# Altium project PCB_MCTA_INT.PrjPcb
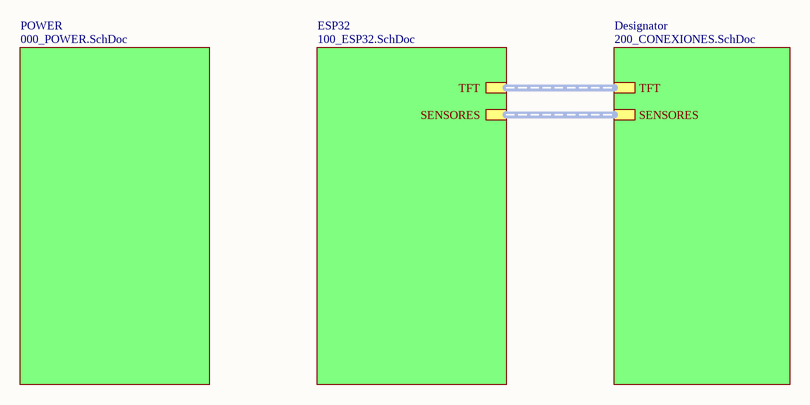
[diagram p0: Main.SchDoc]
4 sheets, 33 parts. Net scope: hierarchical (ports join the sheet entries above them; power ports are global).
Board file: PCB_MACETA.PcbDoc
Sheets:
  Main.SchDoc
    POWER = 000_POWER.SchDoc
    ESP32 = 100_ESP32.SchDoc
    Designator = 200_CONEXIONES.SchDoc

## Sheet Main.SchDoc: Maceta_Inteligente
size A4; DrawnBy: Alexis Andres Valencia; Revision: V1R1; SheetNumber: 1; SheetTotal: 4

### Sub-sheets
Designator = 200_CONEXIONES.SchDoc: TFT (harness TFT_HARNESS), SENSORES (harness SESORES_HARNESS)
ESP32 = 100_ESP32.SchDoc: TFT (harness TFT_HARNESS), SENSORES (harness SESORES_HARNESS)
POWER = 000_POWER.SchDoc: no entries

### Buses and harness runs
harness sheet Designator/SENSORES = sheet ESP32/SENSORES
harness sheet Designator/TFT = sheet ESP32/TFT

## Sheet 000_POWER.SchDoc: MACETA INTELIGENTE
size A4; DrawnBy: ALEXIS VALENCIA; SheetNumber: 2; SheetTotal: 4
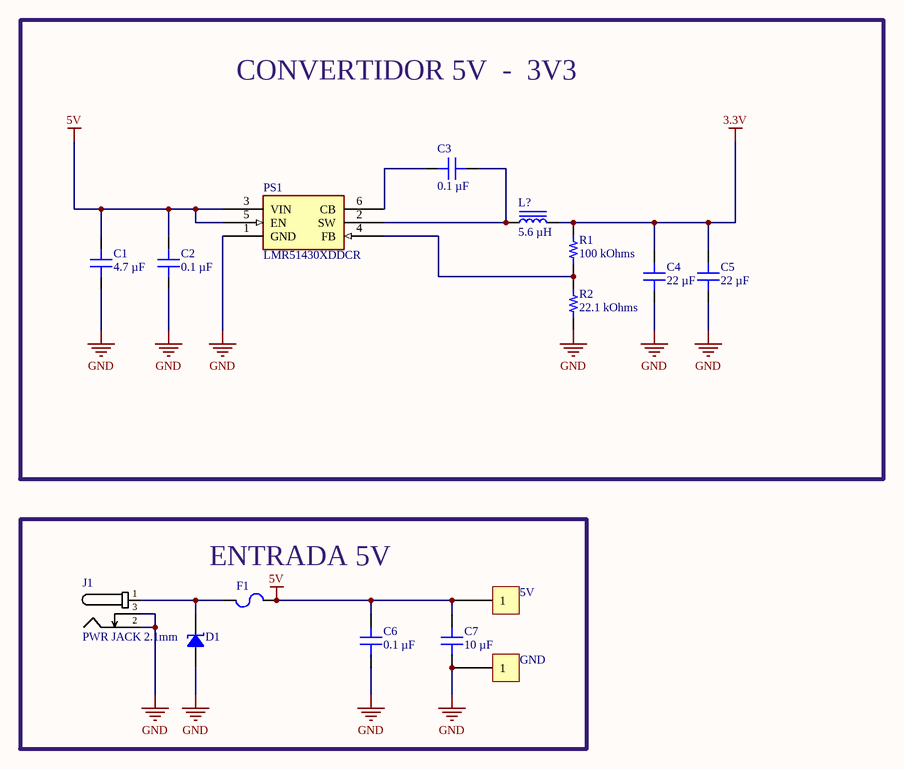
[diagram p1: 000_POWER.SchDoc]

### Parts
C1  4.7 µF  [CAP 0603_1608]
C2  0.1 µF  [CAP 0603_1608]
C3  0.1 µF  [CAP 0603_1608]
C4  22 µF  [CAP 0603_1608]
C5  22 µF  [CAP 0603_1608]
C6  0.1 µF  [CAP 0603_1608]
C7  10 µF  [CAP 0603_1608]
D1  SMAJ5.0A  [DO214AC SMA]  (value not drawn)
F1  MFU1206FF05000P100  [FUSE 1206_3216 0.6MM]  (value not drawn)
J1  PWR JACK 2.1mm  [CON_POWER_BARREL_2.1MM_3CONN]
L1  5.6 µH  [WURTH WE-PD 1280]
PS1  LMR51430XDDCR  [SOT95P280X110-6N]
R1  100 kOhms  [RES 0603_1608]
R2  22.1 kOhms  [RES 0603_1608]
TP1  5V  [Pad_SMD]
TP2  GND  [Pad_SMD]

### Blocks framed on the sheet
CONVERTIDOR 5V  -  3V3: C1-C5 L1 PS1 R1 R2
ENTRADA 5V: C6 C7 D1 F1 J1 TP1 TP2

### Nets
3.3V: C4.2 C5.2 L1.2 R1.2
5V: C1.2 C2.2 C6.2 C7.2 F1.2 PS1.3(VIN) PS1.5(EN) TP1.TP?(1)
GND: C1.1 C2.1 C4.1 C5.1 C6.1 C7.1 D1.1 J1.2 J1.3 PS1.1(GND) R2.1 TP2.TP?(1)
NetC3_1: C3.1 L1.1 PS1.2(SW)
NetC3_2: C3.2 PS1.6(CB)
NetD1_2: D1.2 F1.1 J1.1
NetPS1_4: PS1.4(FB) R1.1 R2.2

### Library data of the parts
C1 = 06033D475KAT2A: CAP CER 4.7UF 25V X5R 0603; manufacturer: KYOCERA AVX; Tolerance: ±10%; Part Number: 06033D475KAT2A; Capacitance: 4.7 µF; Applications: General Purpose; componentlink1description: Datasheet; componentlink1url: https://datasheets.kyocera-avx.com/cx5r.pdf; componentlink2description: DigiKey Link; componentlink2url: https://www.digikey.com/en/products/detail/kyocera-avx/06033D475KAT2A/10815061; Device Package: 0603 (1608 Metric); lastupdated: 6/04/2026 7:22:31 p. m.; Lifecycle Status: Active; Minimum Order: 1; Mounting Type: Surface Mount, MLCC; Operating Temperature: -55°C ~ 85°C; Package / Case: 0603 (1608 Metric); packaging: TapeAndReel; partid: 35784; Part Status: Active; price: 0.09; series: KGM - X5R; Size / Dimension: 0.063" L x 0.031" W (1.60mm x 0.80mm); Supplier 1: DigiKey; Supplier Part Number 1: 478-KGM15CR51E475KTCT-ND; Temperature Coefficient: X5R; Thickness (Max): 0.039" (1.00mm); value: 4.7 µF; Voltage - Rated: 25V
C2 C3 C6 = CL10E104KC8VPNC: CAP CER 100NF 100V X8L 0603; manufacturer: Samsung Electro-Mechanics; Tolerance: ±10%; Part Number: CL10E104KC8VPNC; Capacitance: 0.1 µF; Applications: Automotive; componentlink1description: Datasheet; componentlink1url: https://mm.digikey.com/Volume0/opasdata/d220001/medias/docus/5458/CL10E104KC8VPNC_Spec.pdf; componentlink2description: DigiKey Link; componentlink2url: https://www.digikey.com/en/products/detail/samsung-electro-mechanics/CL10E104KC8VPNC/20498486; Device Package: 0603 (1608 Metric); Features: General Purpose; lastupdated: 6/04/2026 7:18:46 p. m.; Lifecycle Status: Active; Minimum Order: 1; Mounting Type: Surface Mount, MLCC, Epoxy; Operating Temperature: -55°C ~ 150°C; Package / Case: 0603 (1608 Metric); packaging: TapeAndReel; partid: 68845; price: 0.04; Ratings: AEC-Q200; series: CL; Size / Dimension: 0.063" L x 0.031" W (1.60mm x 0.80mm); Supplier 1: DigiKey; Supplier Part Number 1: 1276-CL10E104KC8VPNCCT-ND; Temperature Coefficient: X8L; Thickness (Max): 0.035" (0.88mm); value: 0.1 µF; Voltage - Rated: 100V
C4 C5 = 0603YD226MAT2A: CAP CER 22UF 16V X5R 0603; manufacturer: KYOCERA AVX; Tolerance: ±20%; Part Number: 0603YD226MAT2A; Capacitance: 22 µF; Applications: General Purpose; componentlink1description: Datasheet; componentlink1url: https://datasheets.kyocera-avx.com/cx5r-KGM.pdf; componentlink2description: DigiKey Link; componentlink2url: https://www.digikey.com/en/products/detail/kyocera-avx/0603YD226MAT2A/17866383; Device Package: 0603 (1608 Metric); lastupdated: 6/04/2026 7:18:42 p. m.; Lifecycle Status: Active; Minimum Order: 1; Mounting Type: Surface Mount, MLCC; Operating Temperature: -55°C ~ 85°C; Package / Case: 0603 (1608 Metric); packaging: TapeAndReel; partid: 68615; price: 0.11; series: KGM - X5R; Size / Dimension: 0.063" L x 0.031" W (1.60mm x 0.80mm); Supplier 1: DigiKey; Supplier Part Number 1: 478-KGM15CR51C226MTCT-ND; Temperature Coefficient: X5R; Thickness (Max): 0.039" (1.00mm); value: 22 µF; Voltage - Rated: 16V
C7 = 0603X106M100CT: CAP CER 10UF 10V X5R 0603; manufacturer: Walsin Technology Corporation; Tolerance: ±20%; Part Number: 0603X106M100CT; Capacitance: 10 µF; Applications: General Purpose; componentlink1description: Datasheet; componentlink1url: https://www.passivecomponent.com/wp-content/uploads/datasheet/WTC_MLCC_General_Purpose.pdf; componentlink2description: DigiKey Link; componentlink2url: https://www.digikey.com/en/products/detail/walsin-technology-corporation/0603X106M100CT/15983159; Device Package: 0603 (1608 Metric); lastupdated: 6/04/2026 7:17:37 p. m.; Lifecycle Status: Active; Minimum Order: 1; Mounting Type: Surface Mount, MLCC; Operating Temperature: -55°C ~ 85°C; Package / Case: 0603 (1608 Metric); packaging: TapeAndReel; partid: 64846; price: 0.01; series: -; Size / Dimension: 0.063" L x 0.031" W (1.60mm x 0.80mm); Supplier 1: DigiKey; Supplier Part Number 1: 1292-0603X106M100CT-ND; Temperature Coefficient: X5R; Thickness (Max): 0.037" (0.95mm); value: 10 µF; Voltage - Rated: 10V
D1 = SMAJ5.0A: TVS DIODE 5VWM 9.2VC DO214AC; Manufacturer: Littelfuse Inc.; Current - Peak Pulse (10/1000µs): 43.5A; Power Line Protection: No; Power - Peak Pulse: 400W; Type: Zener; Unidirectional Channels: 1; Voltage - Breakdown (Min): 6.4V; Voltage - Clamping (Max) @ Ipp: 9.2V; Voltage - Reverse Standoff (Typ): 5V; Part Number: SMAJ5.0A; Applications: General Purpose; ComponentLink1Description: Datasheet; ComponentLink1URL: https://www.littelfuse.com/~/media/electronics/datasheets/tvs_diodes/littelfuse_tvs_diode_smaj_datasheet.pdf.pdf; ComponentLink2Description: DigiKey Link; ComponentLink2URL: https://www.digikey.com/en/products/detail/littelfuse-inc/SMAJ5-0A/762250; LastUpdated: 5/04/2026 8:34:16 p. m.; Lifecycle Status: Active; Minimum Order: 1; Mounting Type: Surface Mount; Operating Temperature: -65°C ~ 150°C (TJ); Package / Case: DO-214AC, SMA; Packaging: TapeAndReel; PartId: 5719; Part Status: Active; Price: 0.06; Series: SMAJ; Supplier 1: DigiKey; Supplier Part Number 1: SMAJ5.0ALFCT-ND; Supplier Device Package: DO-214AC (SMA)
F1 = MFU1206FF05000P100: FUSE BOARD MOUNT 5A 63VDC 1206; Manufacturer: Vishay Beyschlag; Approval Agency: UL; Breaking Capacity @ Rated Voltage: 50A; Fuse Type: Board Mount (Cartridge Style Excluded); Melting I²t: 0.2275; Response Time: Fast Blow; Voltage Rating - DC: 63V; Part Number: MFU1206FF05000P100; Approvals: UL; ComponentLink1Description: Datasheet; ComponentLink1URL: http://www.vishay.com/docs/28747/mfuserie.pdf; ComponentLink2Description: DigiKey Link; ComponentLink2URL: http://digikey.com/product-detail/en/vishay-beyschlag/MFU1206FF05000P100/MFU12065.00CT-ND/1206572; Current Rating (Amps): 5A; Device Package: 1206 (3216 Metric); LastUpdated: 2/09/2020 1:30:46 a. m.; Lifecycle Status: Active; Minimum Order: 1; Mounting Type: Surface Mount; Operating Temperature: -55°C ~ 125°C; Package / Case: 1206 (3216 Metric); Packaging: TapeAndReel; Part Status: Active; Price: 0.30; Series: MFU; Size / Dimension: 0.126" L x 0.063" W x 0.022" H (3.20mm x 1.60mm x 0.55mm); Supplier 1: DigiKey; Supplier Part Number 1: MFU12065.00CT-ND
J1 = Con_Power_Jack_2.1mm_3pins: CONN PWR JACK 2X5.5MM SOLDER; Manufacturer: HCTL; Manufacturer Part Number: HC-DC-005-2.0T; Supplier 1: LCSC; Supplier Part Number 1: C3010533; ComponentLink1Description: LCSC; ComponentLink1URL: https://www.lcsc.com/product-detail/AC-DC-Power-Connectors_HCTL-HC-DC-005-2-0T_C3010533.html
L1 = 74477005: FIXED IND 5.6UH 8A 17 MOHM SMD; Manufacturer: Würth Elektronik; Current - Saturation: 8.2A; DC Resistance (DCR): 17mOhm Max; Frequency - Self Resonant: 24MHz; Inductance Frequency - Test: 1 kHz; Material - Core: Ferrite; Shielding: Shielded; Tolerance: -20%, +40%; Type: Drum Core, Wirewound; Part Number: 74477005; ComponentLink2Description: DigiKey Link; ComponentLink2URL: https://www.digikey.com/en/products/detail/würth-elektronik/74477005/9859283; Current Rating (Amps): 8 A; Device Package: Nonstandard; Height - Seated (Max): 0.315" (8.00mm); Inductance: 5.6 µH; LastUpdated: 5/04/2026 9:05:06 p. m.; Lifecycle Status: Active; Minimum Order: 1; Mounting Type: Surface Mount; Operating Temperature: -40°C ~ 125°C; Package / Case: Nonstandard; Packaging: TapeAndReel; PartId: 5767; Part Status: Active; Price: 1.20; Ratings: AEC-Q200; Series: WE-PD; Size / Dimension: 0.472" L x 0.472" W (12.00mm x 12.00mm); Supplier 1: DigiKey; Supplier Part Number 1: 732-13489-1-ND; Value: 5.6 µH
PS1 = LMR51430XDDCR: Power Supply; Manufacturer_Name: Texas Instruments; Datasheet Link: https://www.ti.com/lit/ds/symlink/lmr51430.pdf?HQS=dis-mous-null-mousermode-dsf-pf-null-wwe&ts=1665567212982&ref_url=https%253A%252F%252Fwww.mouser.co.uk%252F; Height: 1.1mm; Manufacturer_Part_Number: LMR51430XDDCR; Mouser Part Number: 595-LMR51430XDDCR; Mouser Price/Stock: https://www.mouser.co.uk/ProductDetail/Texas-Instruments/LMR51430XDDCR?qs=vvQtp7zwQdP8miJIr5Aupg%3D%3D; Arrow Part Number: LMR51430XDDCR; Arrow Price/Stock: https://www.arrow.com/en/products/lmr51430xddcr/texas-instruments.html?utm_currency=USD&region=asia
R1 = AA0603FR-07100KL: RES SMD 100K OHM 1% 1/10W 0603; Manufacturer: Yageo; Power (Watts): 0.1W, 1/10W; Temperature Coefficient: ±150ppm/°C; Part Number: AA0603FR-07100KL; Value: 100 kOhms; ComponentLink1Description: Datasheet; ComponentLink1URL: https://www.yageo.com/upload/media/product/productsearch/datasheet/rchip/PYu-AA_51_RoHS_L_3.pdf; ComponentLink2Description: DigiKey Link; ComponentLink2URL: https://www.digikey.com/en/products/detail/yageo/AA0603FR-07100KL/5888687; Composition: Thick Film; Device Package: 0603 (1608 Metric); Features: Anti-Sulfur, Automotive AEC-Q200, Moisture Resistant; Height - Seated (Max): 0.022" (0.55mm); LastUpdated: 6/04/2026 7:43:21 p. m.; Lifecycle Status: Active; Minimum Order: 1; Number of Terminations: 2; Operating Temperature: -55°C ~ 155°C; Package / Case: 0603 (1608 Metric); Packaging: TapeAndReel; PartId: 78895; Price: 0.01; Ratings: AEC-Q200; Resistance: 100 kOhms; Series: AA; Size / Dimension: 0.063" L x 0.031" W (1.60mm x 0.80mm); Supplier 1: DigiKey; Supplier Part Number 1: 13-AA0603FR-07100KLCT-ND; Supplier Device Package: 0603; Tolerance: ±1%
R2 = AC0603FR-0722K1L: RES SMD 22.1K OHM 1% 1/10W 0603; Manufacturer: Yageo; Power (Watts): 0.1W, 1/10W; Temperature Coefficient: ±100ppm/°C; Part Number: AC0603FR-0722K1L; Value: 22.1 kOhms; ComponentLink1Description: Datasheet; ComponentLink1URL: https://www.yageo.com/upload/media/product/productsearch/datasheet/rchip/PYu-AC_51_RoHS_L_7.pdf; ComponentLink2Description: DigiKey Link; ComponentLink2URL: https://www.digikey.com/en/products/detail/yageo/AC0603FR-0722K1L/5895923; Composition: Thick Film; Device Package: 0603 (1608 Metric); Features: Automotive AEC-Q200, Moisture Resistant; Height - Seated (Max): 0.022" (0.55mm); LastUpdated: 6/04/2026 7:43:51 p. m.; Lifecycle Status: Active; Minimum Order: 1; Number of Terminations: 2; Operating Temperature: -55°C ~ 155°C; Package / Case: 0603 (1608 Metric); Packaging: CutTape; PartId: 15830; Part Status: Active; Price: 0.01; Ratings: AEC-Q200; Resistance: 22.1 kOhms; Series: AC; Size / Dimension: 0.063" L x 0.031" W (1.60mm x 0.80mm); Supplier 1: DigiKey; Supplier Part Number 1: YAG5325CT-ND; Supplier Device Package: 0603; Tolerance: ±1%
TP1 TP2 = Test: Test1.5mm

## Sheet 100_ESP32.SchDoc: MACETA INTELIGENTE
size A4; DrawnBy: ALEXIS VALENCIA; SheetNumber: 3; SheetTotal: 4
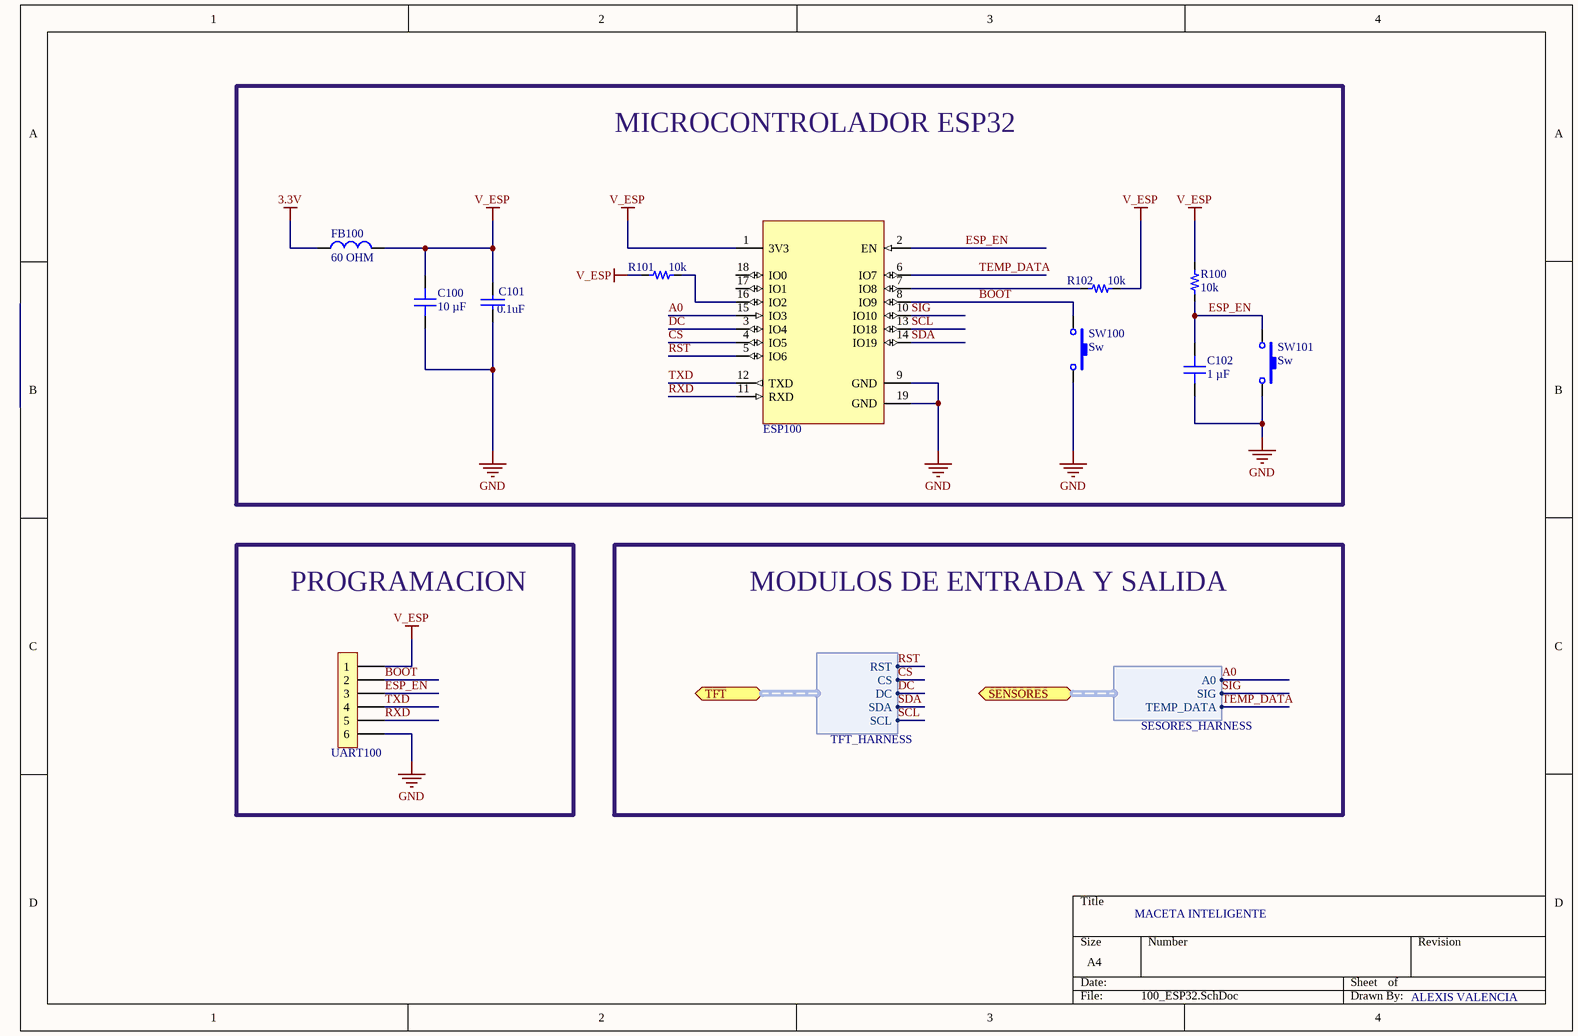
[diagram p2: 100_ESP32.SchDoc]

### Parts
C100  10 µF  [CAP 0603_1608]
C101  value 0.1uF  [0603_cap]  (hidden comment: 0.1uF 50V)
C102  1 µF  [CAP 0603_1608]
ESP100  ESP32-C3-WROOM-02-N4  [ESP32-C3-WROOM-02-N4]  (value not drawn)
FB100  value 60 OHM  [0603_fb]  (hidden comment: 60OHM 2A)
R100  value 10k  [0603_res]  (hidden comment: 10k 1/10W)
R101  value 10k  [0603_res]  (hidden comment: 10k 1/10W)
R102  value 10k  [0603_res]  (hidden comment: 10k 1/10W)
SW100  Sw  [Sw_PUSH_4.5x4.5x5mm]
SW101  Sw  [Sw_PUSH_4.5x4.5x5mm]
UART100  6x1  [H_6x1_TH_100mil]  (value not drawn)  (no BOM)

### Blocks framed on the sheet
MICROCONTROLADOR ESP32: C100-C102 ESP100 FB100 R100-R102 SW100 SW101
PROGRAMACION: UART100

### Ports
SENSORES (bidir, harness SESORES_HARNESS), TFT (bidir, harness TFT_HARNESS)

### Harnesses
TFT_HARNESS: RST, CS, DC, SDA, SCL
SESORES_HARNESS: A0, SIG, TEMP_DATA

### Nets
3.3V: FB100.1
GND: C100.1 C101.2 C102.1 ESP100.9(GND) ESP100.19(GND) SW100.2 SW101.2 UART100.6
V_ESP: C100.2 C101.1 ESP100.1(3V3) FB100.2 R100.2 R101.1 R102.2 UART100.1
A0: ESP100.15(IO3) ; port SENSORES.A0
BOOT: ESP100.8(IO9) SW100.1 UART100.2
CS: ESP100.4(IO5) ; port TFT.CS
DC: ESP100.3(IO4) ; port TFT.DC
ESP_EN: C102.2 ESP100.2(EN) R100.1 SW101.1 UART100.3
RST: ESP100.5(IO6) ; port TFT.RST
RXD: ESP100.11(RXD) UART100.5
SCL: ESP100.13(IO18) ; port TFT.SCL
SDA: ESP100.14(IO19) ; port TFT.SDA
SIG: ESP100.10(IO10) ; port SENSORES.SIG
TEMP_DATA: ESP100.6(IO7) ; port SENSORES.TEMP_DATA
TXD: ESP100.12(TXD) UART100.4
NetESP100_7: ESP100.7(IO8) R102.1
NetESP100_16: ESP100.16(IO2) R101.2

Not connected (* = marked no-connect by the designer): ESP100 17(IO1) 18(IO0)

### Notes on the sheet
- MODULOS DE ENTRADA Y SALIDA

### Library data of the parts
C100 = 06033D106KAT2A: CAP CER 10UF 25V X5R 0603; manufacturer: KYOCERA AVX; Tolerance: ±10%; Part Number: 06033D106KAT2A; Capacitance: 10 µF; Applications: General Purpose; componentlink1description: Datasheet; componentlink1url: https://datasheets.kyocera-avx.com/cx5r-KGM.pdf; componentlink2description: DigiKey Link; componentlink2url: https://www.digikey.com/en/products/detail/kyocera-avx/06033D106KAT2A/17866340; Device Package: 0603 (1608 Metric); lastupdated: 6/04/2026 7:18:42 p. m.; Lifecycle Status: Active; Minimum Order: 1; Mounting Type: Surface Mount, MLCC; Operating Temperature: -55°C ~ 85°C; Package / Case: 0603 (1608 Metric); packaging: TapeAndReel; partid: 68623; price: 0.08; series: KGM - X5R; Size / Dimension: 0.063" L x 0.031" W (1.60mm x 0.80mm); Supplier 1: DigiKey; Supplier Part Number 1: 478-KGM15CR51E106KTCT-ND; Temperature Coefficient: X5R; Thickness (Max): 0.039" (1.00mm); value: 10 µF; Voltage - Rated: 25V
C101 = Cap_0.1uF_0603_50V: 50V 100nF Y5V -20%~+80% 0603 Multilayer Ceramic Capacitors MLCC - SMD/SMT ROHS; Manufacturer: Walsin Tech Corp; Manufacturer Part Number: 0603F104Z500CT; Supplier 1: LCSC; Supplier Part Number 1: C83060; ComponentLink1Description: LCSC; ComponentLink1URL: https://www.lcsc.com/product-detail/Multilayer-Ceramic-Capacitors-MLCC-SMD-SMT_Walsin-Tech-Corp-0603F104Z500CT_C83060.html
C102 = 0603B105K250CT: CAP CER 1UF 25V X7R 0603; manufacturer: Walsin Technology Corporation; Tolerance: ±10%; Part Number: 0603B105K250CT; Capacitance: 1 µF; Applications: General Purpose; componentlink1description: Datasheet; componentlink1url: https://www.passivecomponent.com/wp-content/uploads/datasheet/WTC_MLCC_General_Purpose.pdf; componentlink2description: DigiKey Link; componentlink2url: https://www.digikey.com/en/products/detail/walsin-technology-corporation/0603B105K250CT/14836817; Device Package: 0603 (1608 Metric); lastupdated: 6/04/2026 7:22:13 p. m.; Lifecycle Status: Active; Minimum Order: 1; Mounting Type: Surface Mount, MLCC; Operating Temperature: -55°C ~ 125°C; Package / Case: 0603 (1608 Metric); packaging: TapeAndReel; partid: 41189; Part Status: Active; price: 0.01; series: -; Size / Dimension: 0.063" L x 0.031" W (1.60mm x 0.80mm); Supplier 1: DigiKey; Supplier Part Number 1: 1292-0603B105K250CT-ND; Temperature Coefficient: X7R; Thickness (Max): 0.037" (0.95mm); value: 1 µF; Voltage - Rated: 25V
ESP100 = MCU_ESP32-C3-WROOM-02-N4: RF TXRX MOD BT WIFI PCB TH SMD; Manufacturer: Espressif Systems; Manufacturer Part Number: ESP32-C3-WROOM-02-N4; Supplier 1: LCSC; Supplier Part Number 1: C2934560; ComponentLink1Description: LCSC; ComponentLink1URL: https://lcsc.com/product-detail/WiFi-Modules_Espressif-Systems-ESP32-C3-WROOM-02-N4_C2934560.html
FB100 = FB_60_0603_2A: 2A 1 100mΩ 60Ω@100MHz ±25% 0603 Ferrite Beads ROHS; Manufacturer: TAI-TECH; Manufacturer Part Number: HCB1608KF-600T20; ComponentLink1Description: LCSC; ComponentLink1URL: https://www.lcsc.com/product-detail/Ferrite-Beads_TAI-TECH-HCB1608KF-600T20_C369516.html; Supplier 1: LCSC; Supplier Part Number 1: C369516
R100-R102 = Res_10k_0603_1/10W: RES SMD 10k OHM 5% 1/10W 0603; Manufacturer: FOJAN; Manufacturer Part Number: FRC0603J103TS; ComponentLink1URL: https://www.lcsc.com/product-detail/Chip-Resistor-Surface-Mount_FOJAN-FRC0603J103TS_C2930027.html; Supplier 1: LCSC; Supplier Part Number 1: C2930027; ComponentLink1Description: LCSC
SW100 SW101 = Sw_PUSH_4.5x4.5x5.0xmm: SWITCH TACTILE SPST-NO 0.05A 12V; Manufacturer: BZCN; Manufacturer Part Number: TSC015A05026A; Supplier 1: LCSC; Supplier Part Number 1: C2888509; Last modified by: N-A.Potosi; Last modified date: 20190222; ComponentLink1Description: LCSC; ComponentLink1URL: https://www.lcsc.com/product-detail/Tactile-Switches_BZCN-TSC015A05026A_C2888509.html
UART100 = H_Male_6x1_TH_100mil: ComponentLink1Description: LCSC

## Sheet 200_CONEXIONES.SchDoc: MACETA INTELIGENTE
size A4; DrawnBy: ALEXIS VALENCIA; SheetNumber: 4; SheetTotal: 4
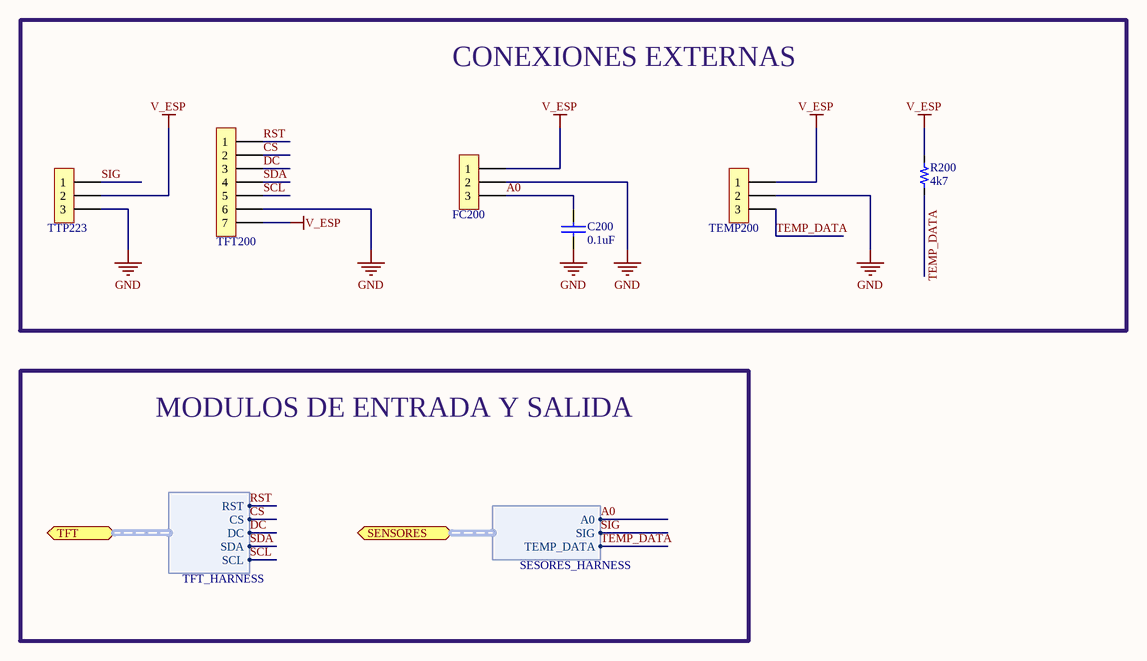
[diagram p3: 200_CONEXIONES.SchDoc]

### Parts
C200  value 0.1uF  [0603_cap]  (hidden comment: 0.1uF 50V)
FC200  3x1  [H_3X1_TH_100mil]  (value not drawn)  (no BOM)
R200  value 4k7  [0603_res]  (hidden comment: 4k7 1/10W)
TEMP200  3x1  [H_3X1_TH_100mil]  (value not drawn)  (no BOM)
TFT200  7x1  [H_7x1_TH_100mil]  (value not drawn)  (no BOM)
TTP223  3x1  [H_3X1_TH_100mil]  (value not drawn)  (no BOM)

### Blocks framed on the sheet
CONEXIONES EXTERNAS: C200 FC200 R200 TEMP200 TFT200 TTP223

### Ports
SENSORES (bidir, harness SESORES_HARNESS), TFT (bidir, harness TFT_HARNESS)

### Harnesses
TFT_HARNESS: RST, CS, DC, SDA, SCL
SESORES_HARNESS: A0, SIG, TEMP_DATA

### Nets
GND: C200.2 FC200.2 TEMP200.2 TFT200.6 TTP223.3
V_ESP: FC200.1 R200.1 TEMP200.1 TFT200.7 TTP223.2
A0: C200.1 FC200.3 ; port SENSORES.A0
CS: TFT200.2 ; port TFT.CS
DC: TFT200.3 ; port TFT.DC
RST: TFT200.1 ; port TFT.RST
SCL: TFT200.5 ; port TFT.SCL
SDA: TFT200.4 ; port TFT.SDA
SIG: TTP223.1 ; port SENSORES.SIG
TEMP_DATA: R200.2 TEMP200.3 ; port SENSORES.TEMP_DATA

### Notes on the sheet
- MODULOS DE ENTRADA Y SALIDA

### Library data of the parts
C200 = Cap_0.1uF_0603_50V: as C101 on sheet 100_ESP32; Supplier 1: LCSC; Supplier Part Number 1: C83060; ComponentLink1Description: LCSC; ComponentLink1URL: https://www.lcsc.com/product-detail/Multilayer-Ceramic-Capacitors-MLCC-SMD-SMT_Walsin-Tech-Corp-0603F104Z500CT_C83060.html
FC200 TEMP200 TTP223 = H_Male_3x1_TH_100mil: ComponentLink1Description: LCSC
R200 = Res_4k7_0603_1/10W: 100mW Thick Film Resistor 75V ±1% 4.7kΩ 0603 Chip Resistor - Surface Mount ROHS; Manufacturer: VO; Manufacturer Part Number: SCR0603F4K7; ComponentLink1URL: https://lcsc.com/product-detail/Chip-Resistor-Surface-Mount_VO-SCR0603F4K7_C3016318.html; Supplier 1: LCSC; Supplier Part Number 1: C3016318; ComponentLink1Description: LCSC
TFT200 = H_Male_7x1_TH_100mil: ComponentLink1Description: LCSC

## Nets that join several sheets
3.3V: 000_POWER (C4.2 C5.2 L1.2 R1.2), 100_ESP32 (FB100.1)
GND: 000_POWER (12 pins), 100_ESP32 (8 pins), 200_CONEXIONES (5 pins)
V_ESP: 100_ESP32 (8 pins), 200_CONEXIONES (5 pins)
A0: 100_ESP32 (ESP100.15), 200_CONEXIONES (C200.1 FC200.3)
CS: 100_ESP32 (ESP100.4), 200_CONEXIONES (TFT200.2)
DC: 100_ESP32 (ESP100.3), 200_CONEXIONES (TFT200.3)
RST: 100_ESP32 (ESP100.5), 200_CONEXIONES (TFT200.1)
SCL: 100_ESP32 (ESP100.13), 200_CONEXIONES (TFT200.5)
SDA: 100_ESP32 (ESP100.14), 200_CONEXIONES (TFT200.4)
SIG: 100_ESP32 (ESP100.10), 200_CONEXIONES (TTP223.1)
TEMP_DATA: 100_ESP32 (ESP100.6), 200_CONEXIONES (R200.2 TEMP200.3)